# Altium schematic sheet Peripheral_Section.SchDoc
size A4; DocumentNumber: 8; SheetNumber: 8; SheetTotal: 9
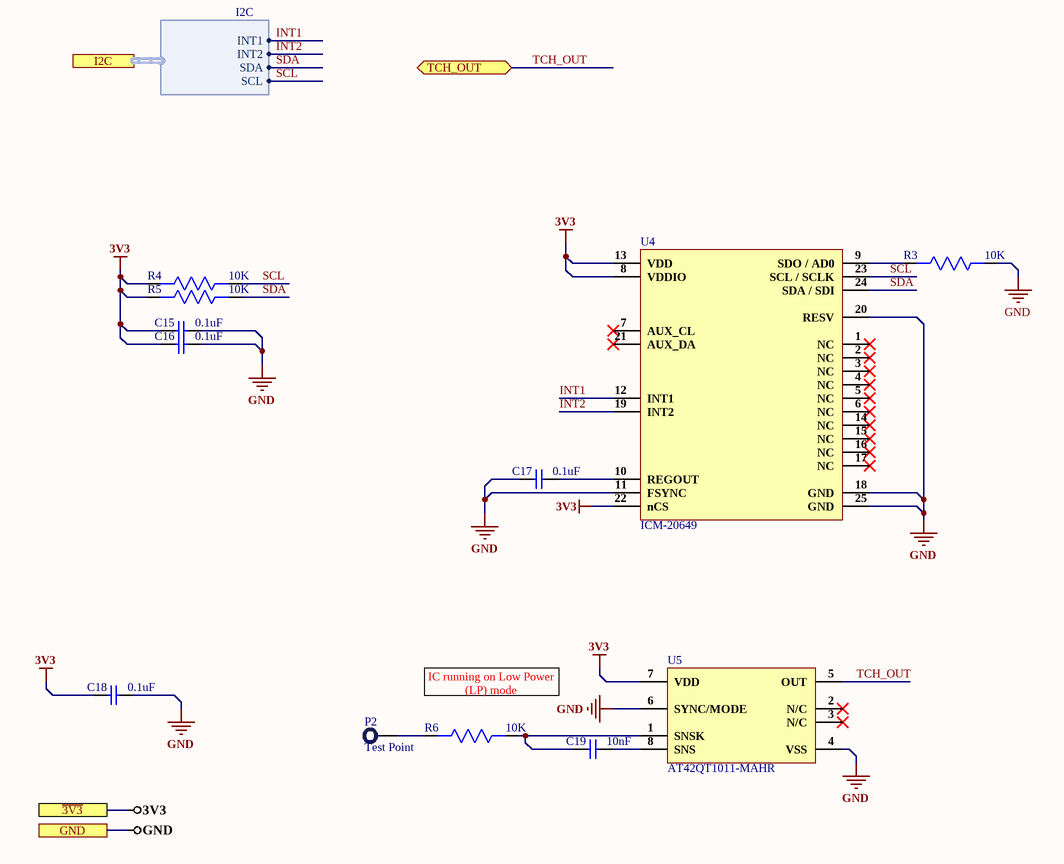
[diagram p0: Peripheral_Section.SchDoc]

## Parts
C15  0.1uF  [CAP 0201]
C16  0.1uF  [CAP 0201]
C17  0.1uF  [CAP 0201]
C18  0.1uF  [CAP 0201]
C19  10nF  [Cap0402]
P2  Test Point  [TEST POINT]
R3  10K  [Res-0201]
R4  10K  [Res-0201]
R5  10K  [Res-0201]
R6  10K  [Res-0201]
U4  ICM-20649  [24-QFN (3x3)]
U5  AT42QT1011-MAHR  [8-UDFN]

## Ports
GND, I2C (harness I2C), TCH_OUT (bidir), ~{3V3}

## Harnesses
I2C: INT1, INT2, SDA, SCL

## Nets
3V3: C15.1 C16.1 C18.1 R4.2 R5.2 U4.8(VDDIO) U4.13(VDD) U4.22(nCS) U5.7(VDD) ; port ~{3V3}
GND: C15.2 C16.2 C17.1 C18.2 R3.1 U4.11(FSYNC) U4.18(GND) U4.20(RESV) U4.25(GND) U5.4(VSS) U5.6(SYNC/MODE) ; port GND
INT1: U4.12(INT1) ; port I2C.INT1
INT2: U4.19(INT2) ; port I2C.INT2
SCL: R4.1 U4.23(SCL_/_SCLK) ; port I2C.SCL
SDA: R5.1 U4.24(SDA_/_SDI) ; port I2C.SDA
TCH_OUT: U5.5(OUT) ; port TCH_OUT
NetC17_2: C17.2 U4.10(REGOUT)
NetC19_1: C19.1 R6.1 U5.1(SNSK)
NetC19_2: C19.2 U5.8(SNS)
NetP2_1: P2.1 R6.2
NetR3_2: R3.2 U4.9(SDO_/_AD0)

Not connected (* = marked no-connect by the designer): U4 1(NC)* 2(NC)* 3(NC)* 4(NC)* 5(NC)* 6(NC)* 7(AUX_CL)* 14(NC)* 15(NC)* 16(NC)* 17(NC)* 21(AUX_DA)*; U5 2(N/C)* 3(N/C)*

## Notes on the sheet
- IC running on Low Power (LP) mode

## Library data of the parts
C15-C18 = GRM033R61E104KE14D: Multilayer Ceramic Capacitors MLCC - SMD/SMT 0201 0.1uF 25volts X5R 10%; Manufacturer: Murata; Capacitance: 100nF; Voltage Rating: 25V; Supplier 1: Mouser; Manufacturer Part Number: GRM033R61E104KE14D; RoHS: Yes; Category: Ceramic Capacitors; Stock 1: 22478; Pricing 1: 1=0.10000, 10=0.03100, 50=0.03100, 100=0.02500, 1000=0.01700, 10000=0.01400 (USD); Mount: Surface Mount; Case/Package: 0201; Case Code (Metric): 0603; Case Code (Imperial): 0201; Weight: 1.2E-05oz; Min Operating Temperature: -55°C; Max Operating Temperature: 85°C; Packaging: Tape and Reel; Tolerance: 10%; Dielectric: X5R; Termination: SMD/SMT; Resistor Type: Ceramic; Voltage Rating (DC): 25V; Package Quantity: 15000; Length: 0.024inch; Width: 0.012inch; Height: 0.3mm; Thickness: 0.013inch; Lead Free: Lead Free; RoHS Compliant: Yes; ComponentLink1URL: http://www.farnell.com/datasheets/2867843.pdf?src-supplier=Farnell; ComponentLink1Description: http://www.farnell.com/datasheets/2867843.pdf?src-supplier=Farnell; ComponentLink2URL: http://www.mouser.com/ds/2/281/c02e-2905.pdf?src-supplier=Mouser; ComponentLink2Description: http://www.mouser.com/ds/2/281/c02e-2905.pdf?src-supplier=Mouser; ComponentLink3URL: http://search.murata.co.jp/Ceramy/image/img/A01X/G101/ENG/GRM033R61E104KE14-01.pdf?src-supplier=Digi-Key; ComponentLink3Description: http://search.murata.co.jp/Ceramy/image/img/A01X/G101/ENG/GRM033R61E104KE14-01.pdf?src-supplier=Digi-Key; ComponentLink4URL: http://www.farnell.com/datasheets/2867843.pdf?src-supplier=Newark; ComponentLink4Description: http://www.farnell.com/datasheets/2867843.pdf?src-supplier=Newark; Supplier Part Number 1: 81-GRM033R61E104KE4D
C19 = CC0402KRX7R8BB103: CAP CER 10000PF 25V X7R 0402; Manufacturer: Yageo; Tolerance: 10%; Supplier 1: Digi-Key; Manufacturer Part Number: CC0402KRX7R8BB103; Stock 1: 0; Pricing 1: 1=0.1, 10=0.021, 100=0.0093, 500=0.00666, 1000=0.00523, 2500=0.00476, 5000=0.00438 (USD); Mount: Surface Mount; Case/Package: 0402; Case Code (Metric): 1005; Case Code (Imperial): 0402; Min Operating Temperature: -55°C; Max Operating Temperature: 125°C; Capacitance: 10nF; Dielectric: X7R; Voltage Rating: 25V; Package Quantity: 1; Packaging: Tape and Reel; Voltage Rating (DC): 25V; Termination: SMD/SMT; Composition: Ceramic; Length: 1mm; Height: 0.5mm; Depth: 0.5mm; Width: 0.02inch; Thickness: 0.022inch; Radiation Hardening: No; REACH SVHC: Unknown; Lead Free: Lead Free; Halogen Free: Halogen Free; ComponentLink1URL: http://www.yageo.com/documents/recent/UPY-GPHC_X7R_6.3V-to-50V_18.pdf?src-supplier=Digi-Key; ComponentLink1Description: http://www.yageo.com/documents/recent/UPY-GPHC_X7R_6.3V-to-50V_18.pdf?src-supplier=Digi-Key; ComponentLink2URL: https://www.verical.com/server-webapp/html/getDatasheet?partID=375418&src-supplier=Verical; ComponentLink2Description: https://www.verical.com/server-webapp/html/getDatasheet?partID=375418&src-supplier=Verical; ComponentLink3URL: http://www.yageo.com/documents/recent/UPY-GPHC_X7R_6.3V-to-50V_8.pdf?src-supplier=Avnet; ComponentLink3Description: http://www.yageo.com/documents/recent/UPY-GPHC_X7R_6.3V-to-50V_8.pdf?src-supplier=Avnet; ComponentLink4URL: https://4donline.ihs.com/images/VipMasterIC/IC/YAGO/YAGO-S-A0003557223/YAGO-S-A0003557223-1.pdf?hkey=52A5661711E402568146F3353EA87419&src-supplier=Element14; ComponentLink4Description: https://4donline.ihs.com/images/VipMasterIC/IC/YAGO/YAGO-S-A0003557223/YAGO-S-A0003557223-1.pdf?hkey=52A5661711E402568146F3353EA87419&src-supplier=Element14; ComponentLink5URL: http://www.farnell.com/datasheets/2167236.pdf?src-supplier=Element14; ComponentLink5Description: http://www.farnell.com/datasheets/2167236.pdf?src-supplier=Element14; ComponentLink6URL: http://www.mouser.com/ds/2/447/Yageo_UPY-GP_NP0_16V-to-50V_9-358835.pdf?src-supplier=Mouser; ComponentLink6Description: http://www.mouser.com/ds/2/447/Yageo_UPY-GP_NP0_16V-to-50V_9-358835.pdf?src-supplier=Mouser; Supplier Part Number 1: 311-1337-1-ND
P2 = TEST POINT: Test Point ON
R3-R6 = CR0201F10K0Q15Z: 10kΩ ±1% 1/20W ±200ppm/℃ 0201 Chip Resistor - Surface Mount RoHS; Manufacturer: Ever Ohms Tech; Package: 0201; Resistance: 10kΩ; Tolerance: ±1%; Power(Watts): 1/20W; Temperature Coefficient: ±200ppm/℃
U4 = ICM-20649: WIDE-FULL SCALE RANGE 6-AXIS MEM; Manufacturer: TDK InvenSense; Sensor Type: Accelerometer,Gyroscope,6 Axis,Temperature; Output Type: SPI,I2C; Supplier 1: Digi-Key; Manufacturer Part Number: ICM-20649; RoHS: Yes; Category: Inertial Measurement Units (IMUs); Stock 1: 4990; Pricing 1: 1=12.32000, 5=8.00000, 10=7.20000, 25=6.40000, 50=5.92000, 100=5.12000, 500=4.80000, 1000=4.48000 (USD); Mount: Surface Mount; Case/Package: QFN; Min Operating Temperature: -40°C; Max Operating Temperature: 85°C; Packaging: Tape and Reel; RoHS Compliant: Yes; Supplier Part Number 1: 1428-1142-1-ND
U5 = AT42QT1011-MAHR: IC SENSR TOUCH/PROX 1CH 8-UDFN; Manufacturer: Microchip; Supplier 1: Digi-Key; Manufacturer Part Number: AT42QT1011-MAHR; RoHS: No; Category: Integrated Circuits (ICs); Stock 1: 3160; Pricing 1: 1=0.61000, 25=0.56000, 100=0.50700 (USD); ComponentLink1URL: http://www.microchip.com/mymicrochip/filehandler.aspx?ddocname=en590560&src-supplier=Digi-Key; ComponentLink1Description: http://www.microchip.com/mymicrochip/filehandler.aspx?ddocname=en590560&src-supplier=Digi-Key; Supplier Part Number 1: AT42QT1011-MAHRCT-ND